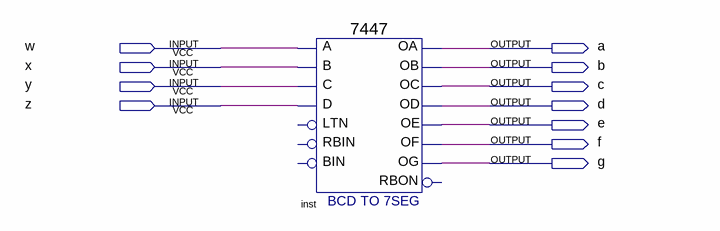
[diagram p0: schematic sheet]
// Quartus schematic FPGA_4x7_7Segment_Decoder.bdf as structural Verilog: 1 symbols, 11 pins
module FPGA_4x7_7Segment_Decoder (
  input  w,
  input  x,
  input  y,
  input  z,
  output a,
  output b,
  output c,
  output d,
  output e,
  output f,
  output g
);

  \7447  inst (
    .B(x), .C(y), .D(z), .A(w), .OB(b), .OC(c), .OE(e), .OD(d), .OF(f), .OG(g), .OA(a));  // open: LTN, RBIN, BIN, RBON
endmodule
